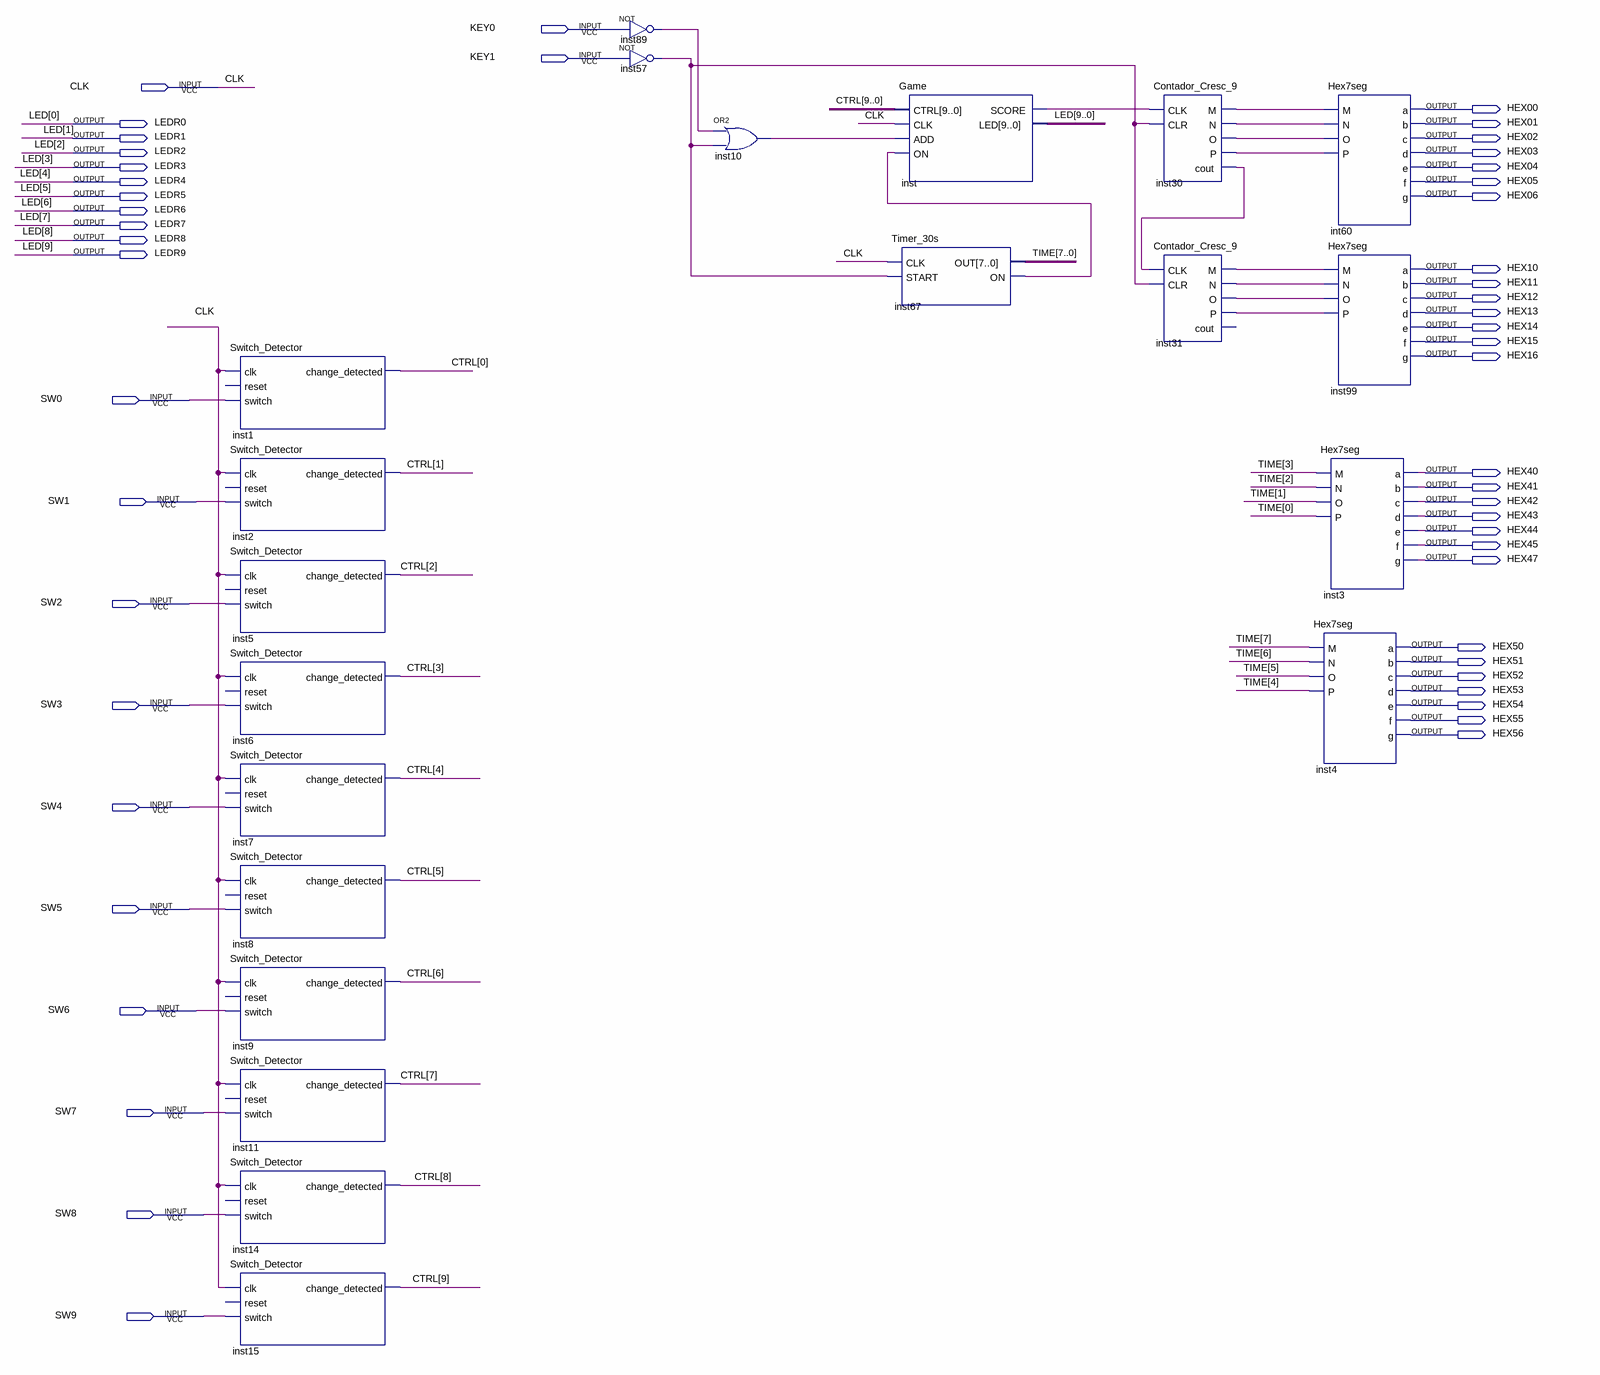
[diagram p0: schematic sheet]
// Quartus schematic ProjetoFinal.bdf as structural Verilog: 21 symbols, 51 pins
module ProjetoFinal (
  input  KEY0,
  input  KEY1,
  input  CLK,
  input  SW0,
  input  SW1,
  input  SW2,
  input  SW3,
  input  SW4,
  input  SW5,
  input  SW6,
  input  SW7,
  input  SW8,
  input  SW9,
  output HEX00,
  output LEDR0,
  output HEX01,
  output LEDR1,
  output HEX02,
  output LEDR2,
  output HEX03,
  output LEDR3,
  output HEX04,
  output LEDR4,
  output HEX05,
  output LEDR5,
  output HEX06,
  output LEDR6,
  output LEDR7,
  output LEDR8,
  output LEDR9,
  output HEX10,
  output HEX11,
  output HEX12,
  output HEX13,
  output HEX14,
  output HEX15,
  output HEX16,
  output HEX40,
  output HEX41,
  output HEX42,
  output HEX43,
  output HEX44,
  output HEX45,
  output HEX47,
  output HEX50,
  output HEX51,
  output HEX52,
  output HEX53,
  output HEX54,
  output HEX55,
  output HEX56
);

  wire inst10_out, inst30_cout, inst30_m, inst30_n, inst30_o, inst30_p, inst31_m, inst31_n, inst31_o,
       inst31_p, inst57_out, inst67_on, inst89_out, inst_score;
  wire [7:0] TIME;
  wire [9:0] CTRL;

  Switch_Detector inst1 (.clk(CLK), .switch(SW0), .change_detected(CTRL[0]));  // open: reset
  Switch_Detector inst2 (.clk(CLK), .switch(SW1), .change_detected(CTRL[1]));  // open: reset
  Switch_Detector inst5 (.clk(CLK), .switch(SW2), .change_detected(CTRL[2]));  // open: reset
  Switch_Detector inst6 (.clk(CLK), .switch(SW3), .change_detected(CTRL[3]));  // open: reset
  Switch_Detector inst7 (.clk(CLK), .switch(SW4), .change_detected(CTRL[4]));  // open: reset
  Switch_Detector inst8 (.clk(CLK), .switch(SW5), .change_detected(CTRL[5]));  // open: reset
  Switch_Detector inst9 (.clk(CLK), .switch(SW6), .change_detected(CTRL[6]));  // open: reset
  Switch_Detector inst11 (.clk(CLK), .switch(SW7), .change_detected(CTRL[7]));  // open: reset
  Switch_Detector inst14 (.clk(CLK), .switch(SW8), .change_detected(CTRL[8]));  // open: reset
  Switch_Detector inst15 (.clk(CLK), .switch(SW9), .change_detected(CTRL[9]));  // open: reset
  not inst89 (inst89_out, KEY0);
  not inst57 (inst57_out, KEY1);
  or inst10 (inst10_out, inst89_out, inst57_out);
  Game inst (
    .CTRL(CTRL), .CLK(CLK), .ADD(inst10_out), .ON(inst67_on), .SCORE(inst_score),
    .LED({LEDR9, LEDR8, LEDR7, LEDR6, LEDR5, LEDR4, LEDR3, LEDR2, LEDR1, LEDR0}));
  Timer_30s inst67 (.CLK(CLK), .START(inst57_out), .OUT(TIME), .ON(inst67_on));
  Contador_Cresc_9 inst30 (
    .CLK(inst_score), .CLR(inst57_out), .M(inst30_m), .N(inst30_n), .O(inst30_o), .P(inst30_p),
    .cout(inst30_cout));
  Contador_Cresc_9 inst31 (
    .CLK(inst30_cout), .CLR(inst57_out), .M(inst31_m), .N(inst31_n), .O(inst31_o), .P(inst31_p));  // open: cout
  Hex7seg inst4 (
    .M(TIME[7]), .N(TIME[6]), .O(TIME[5]), .P(TIME[4]), .a(HEX50), .b(HEX51), .c(HEX52), .d(HEX53),
    .e(HEX54), .f(HEX55), .g(HEX56));
  Hex7seg int60 (
    .M(inst30_m), .N(inst30_n), .O(inst30_o), .P(inst30_p), .a(HEX00), .b(HEX01), .c(HEX02), .d(HEX03),
    .e(HEX04), .f(HEX05), .g(HEX06));
  Hex7seg inst99 (
    .M(inst31_m), .N(inst31_n), .O(inst31_o), .P(inst31_p), .a(HEX10), .b(HEX11), .c(HEX12), .d(HEX13),
    .e(HEX14), .f(HEX15), .g(HEX16));
  Hex7seg inst3 (
    .M(TIME[3]), .N(TIME[2]), .O(TIME[1]), .P(TIME[0]), .a(HEX40), .b(HEX41), .c(HEX42), .d(HEX43),
    .e(HEX44), .f(HEX45), .g(HEX47));

  // Other names for the same wires on the sheet: LED[9:0] = {LEDR9, LEDR8, LEDR7, LEDR6, LEDR5, LEDR4, LEDR3, LEDR2, LEDR1, LEDR0}
endmodule
